# Altium schematic sheet PMUIO _ VCCIO.schdoc
size 297 x 209 mm; Symbol: Drawing-Symbol_A4; Company: 嘉立创EDA; Version: V1.0; Page Size: A4; @Project Name: RK3566; @Update Date: 2026-09-30; @Create Date: 2026-05-20; Device: Drawing-Symbol_A4; @Board Name: Board1; @Page Name: P1; @Create Time: 01:20:11; @Page Count: 2; @Page No: 2; @Schematic Name: Schematic1; @Update Time: 01:20:11; @Assembly Variant: Basic; Border: 1; Title Block Position: 3; Size: A4; Width: 1170; Height: 825; Region Start: 1; X Region Count: 6; Y Region Count: 4; Blade Width: 10; SheetNumber: 3; SheetTotal: 11
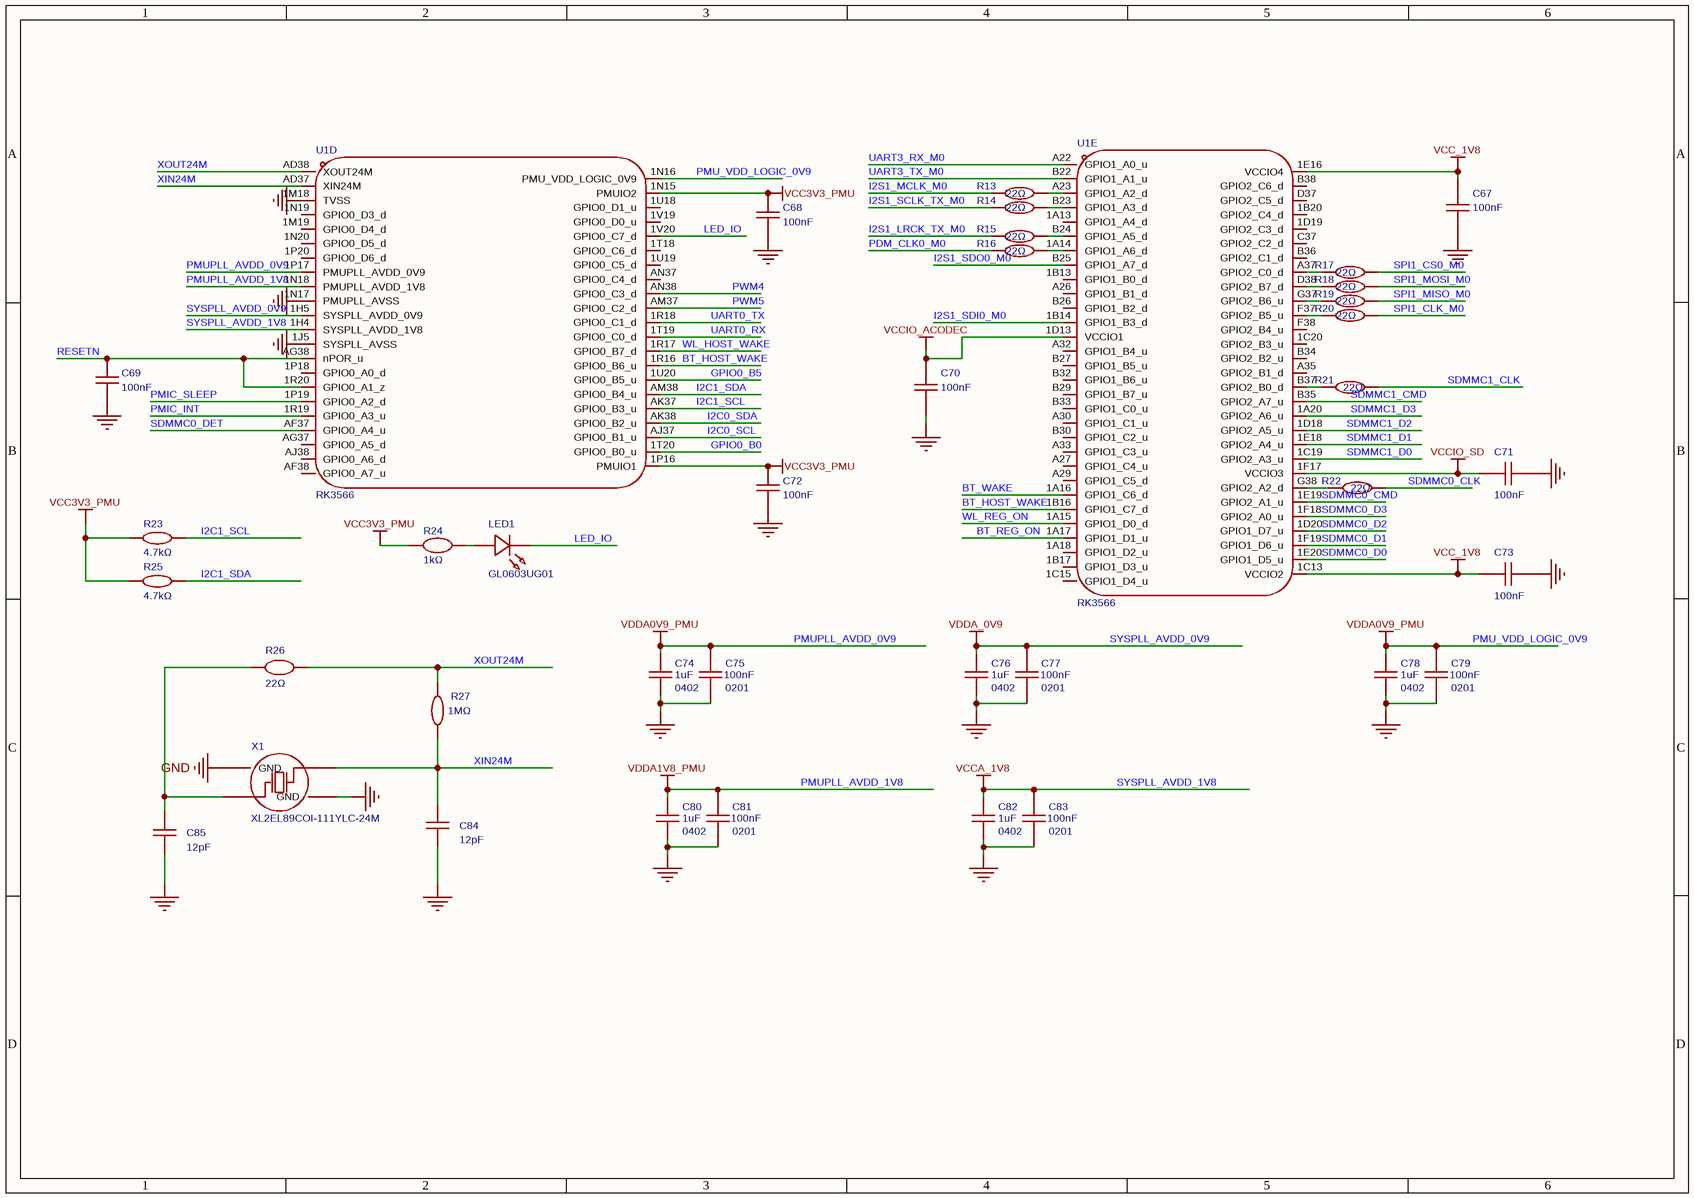
[diagram p0: PMUIO _ VCCIO.schdoc]

## Parts
C67  100nF  [C0201]
C68  100nF  [C0201]
C69  100nF  [C0201]
C70  100nF  [C0201]
C71  100nF  [C0201]
C72  100nF  [C0201]
C73  100nF  [C0201]
C74  1uF  Supplier Footprint: 0402  [C0402]
C75  100nF  Supplier Footprint: 0201  [C0201]
C76  1uF  Supplier Footprint: 0402  [C0402]
C77  100nF  Supplier Footprint: 0201  [C0201]
C78  1uF  Supplier Footprint: 0402  [C0402]
C79  100nF  Supplier Footprint: 0201  [C0201]
C80  1uF  Supplier Footprint: 0402  [C0402]
C81  100nF  Supplier Footprint: 0201  [C0201]
C82  1uF  Supplier Footprint: 0402  [C0402]
C83  100nF  Supplier Footprint: 0201  [C0201]
C84  12pF  [C0402]
C85  12pF  [C0402]
LED1  GL0603UG01  [LED0603-RD]
R13  22Ω  [R0402]
R14  22Ω  [R0402]
R15  22Ω  [R0402]
R16  22Ω  [R0402]
R17  22Ω  [R0402]
R18  22Ω  [R0402]
R19  22Ω  [R0402]
R20  22Ω  [R0402]
R21  22Ω  [R0402]
R22  22Ω  [R0402]
R23  4.7kΩ  [R0402]
R24  1kΩ  [R0603]
R25  4.7kΩ  [R0402]
R26  22Ω  [R0402]
R27  1MΩ  [R0402]
U1  RK3566  [BGA-565_L15.5-W14.4-P0.40_RK3566_1]  (parts D,E of 8)
X1  XL2EL89COI-111YLC-24M  [OSC-SMD_4P-L3.2-W2.5-BL]

## Nets
GND: C67.1 C68.1 C69.1 C70.1 C71.1 C72.1 C73.1 C74.1 C75.1 C76.1 C77.1 C78.1 C79.1 C80.1 C81.1 C82.1 C83.1 C84.1 C85.1 U1.1J5(SYSPLL_AVSS) U1.1M18(TVSS) U1.1N17(PMUPLL_AVSS) X1.2(GND) X1.4(GND)
PMU_VDD_LOGIC_0V9: C74.2 C75.2 C78.2 C79.2 U1.1N16(PMU_VDD_LOGIC_0V9) U1.1P17(PMUPLL_AVDD_0V9)  [also labelled PMUPLL_AVDD_0V9, VDDA0V9_PMU]
PMUPLL_AVDD_1V8: C80.2 C81.2 U1.1N18(PMUPLL_AVDD_1V8)  [also labelled VDDA1V8_PMU]
SYSPLL_AVDD_0V9: C76.2 C77.2 U1.1H5(SYSPLL_AVDD_0V9)  [also labelled VDDA_0V9]
SYSPLL_AVDD_1V8: C82.2 C83.2 U1.1H4(SYSPLL_AVDD_1V8)  [also labelled VCCA_1V8]
VCC3V3_PMU: C68.2 C72.2 R23.1 R24.1 R25.1 U1.1N15(PMUIO2) U1.1P16(PMUIO1)
VCC_1V8: C67.2 C73.2 U1.1C13(VCCIO2) U1.1E16(VCCIO4)
VCCIO_ACODEC: C70.2 U1.1D13(VCCIO1)
VCCIO_SD: C71.2 U1.1F17(VCCIO3)
BT_HOST_WAKE: U1.1B16(GPIO1_C7_d) U1.1R16(GPIO0_B6_u)
BT_REG_ON: U1.1A17(GPIO1_D1_u)
BT_WAKE: U1.1A16(GPIO1_C6_d)
GPIO0_B0: U1.1T20(GPIO0_B0_u)
GPIO0_B5: U1.1U20(GPIO0_B5_u)
I2C0_SCL: U1.AJ37(GPIO0_B1_u)
I2C0_SDA: U1.AK38(GPIO0_B2_u)
I2C1_SCL: R23.2 U1.AK37(GPIO0_B3_u)
I2C1_SDA: R25.2 U1.AM38(GPIO0_B4_u)
I2S1_LRCK_TX_M0: R15.1
I2S1_MCLK_M0: R13.1
I2S1_SCLK_TX_M0: R14.1
I2S1_SDI0_M0: U1.1B14(GPIO1_B3_d)
I2S1_SDO0_M0: U1.B25(GPIO1_A7_d)
LED_IO: LED1.1(K) U1.1V20(GPIO0_C7_d)
PDM_CLK0_M0: R16.1
PMIC_INT: U1.1R19(GPIO0_A3_u)
PMIC_SLEEP: U1.1P19(GPIO0_A2_d)
PWM4: U1.AN38(GPIO0_C3_d)
PWM5: U1.AM37(GPIO0_C2_d)
RESETN: C69.2 U1.1R20(GPIO0_A1_z) U1.AG38(nPOR_u)
SDMMC0_CLK: R22.2
SDMMC0_CMD: U1.1E19(GPIO2_A1_u)
SDMMC0_D0: U1.1E20(GPIO1_D5_u)
SDMMC0_D1: U1.1F19(GPIO1_D6_u)
SDMMC0_D2: U1.1D20(GPIO1_D7_u)
SDMMC0_D3: U1.1F18(GPIO2_A0_u)
SDMMC0_DET: U1.AF37(GPIO0_A4_u)
SDMMC1_CLK: R21.2
SDMMC1_CMD: U1.B35(GPIO2_A7_u)
SDMMC1_D0: U1.1C19(GPIO2_A3_u)
SDMMC1_D1: U1.1E18(GPIO2_A4_u)
SDMMC1_D2: U1.1D18(GPIO2_A5_u)
SDMMC1_D3: U1.1A20(GPIO2_A6_u)
SPI1_CLK_M0: R20.2
SPI1_CS0_M0: R17.2
SPI1_MISO_M0: R19.2
SPI1_MOSI_M0: R18.2
UART0_RX: U1.1T19(GPIO0_C0_d)
UART0_TX: U1.1R18(GPIO0_C1_d)
UART3_RX_M0: U1.A22(GPIO1_A0_u)
UART3_TX_M0: U1.B22(GPIO1_A1_u)
WL_HOST_WAKE: U1.1R17(GPIO0_B7_d)
WL_REG_ON: U1.1A15(GPIO1_D0_d)
XIN24M: C84.2 R27.1 U1.AD37(XIN24M) X1.3(OSC2)
XOUT24M: R26.2 R27.2 U1.AD38(XOUT24M)
NetC85_2: C85.2 R26.1 X1.1(OSC1)
NetLED1_2: LED1.2(A) R24.2
NetR13_2: R13.2 U1.A23(GPIO1_A2_d)
NetR14_2: R14.2 U1.B23(GPIO1_A3_d)
NetR15_2: R15.2 U1.B24(GPIO1_A5_d)
NetR16_2: R16.2 U1.1A14(GPIO1_A6_d)
NetR17_1: R17.1 U1.A37(GPIO2_C0_d)
NetR18_1: R18.1 U1.D38(GPIO2_B7_d)
NetR19_1: R19.1 U1.G37(GPIO2_B6_u)
NetR20_1: R20.1 U1.F37(GPIO2_B5_u)
NetR21_1: R21.1 U1.B37(GPIO2_B0_d)
NetR22_1: R22.1 U1.G38(GPIO2_A2_d)

Not connected (* = marked no-connect by the designer): U1 1A13(GPIO1_A4_d) 1A18(GPIO1_D2_u) 1B13(GPIO1_B0_d) 1B17(GPIO1_D3_u) 1B20(GPIO2_C4_d) 1C15(GPIO1_D4_u) 1C20(GPIO2_B3_u) 1D19(GPIO2_C3_d) 1M19(GPIO0_D4_d) 1N19(GPIO0_D3_d) 1N20(GPIO0_D5_d) 1P18(GPIO0_A0_d) 1P20(GPIO0_D6_d) 1T18(GPIO0_C6_d) 1U18(GPIO0_D1_u) 1U19(GPIO0_C5_d) 1V19(GPIO0_D0_u) A26(GPIO1_B1_d) A27(GPIO1_C4_u) A29(GPIO1_C5_d) A30(GPIO1_C1_u) A32(GPIO1_B4_u) A33(GPIO1_C3_u) A35(GPIO2_B1_d) AF38(GPIO0_A7_u) AG37(GPIO0_A5_d) AJ38(GPIO0_A6_d) AN37(GPIO0_C4_d) B26(GPIO1_B2_d) B27(GPIO1_B5_u) B29(GPIO1_B7_u) B30(GPIO1_C2_u) B32(GPIO1_B6_u) B33(GPIO1_C0_u) B34(GPIO2_B2_u) B36(GPIO2_C1_d) B38(GPIO2_C6_d) C37(GPIO2_C2_d) D37(GPIO2_C5_d) F38(GPIO2_B4_u)

## Notes on the sheet
- 创建日期
- 2026-09-30
- 原理图
- 板子
- Schematic1
- Board1
- 更新日期
- 图页
- P1
- 绘制
- 审阅
- RK3566
- 版本
- V1.0
- 尺寸
- A4
- 页    2    共    2
- 嘉立创EDA

## Library data of the parts
C67 C70 C71 C73 C75 C77 C79 C81 C83 = CL03A104KO3NNNC: 容值:100nF;精度:±10%;额定电压:16V;材质(温度系数):X5R;; Manufacturer: SAMSUNG(三星); Symbol: CL05B104KB54PNC; 3D Model: e8033a7cb35143ffb28e3b81b2577ea0; 3D Model Transform: 23.622,11.811,0,0,0,0,0,0,0; Tolerance: ±10%; Voltage Rated: 16V; Temperature Coefficient: X5R; AddInBom: yes; ModelName: C0201_L0.6-W0.3-H0.3; Device: CL03A104KO3NNNC; JLCPCB Part Class: Extended Part; LCSC Part Name: 100nF ±10% 16V; Supplier Part: C307380; Manufacturer Part: CL03A104KO3NNNC; Datasheet: https://atta.szlcsc.com/upload/public/pdf/source/20181009/C307380_E0679AAF9658ADA26DBF30CED0CA6925.pdf; Supplier: LCSC; Value: 100nF; ConvertToPcb: yes; FootprintName: C0201
  C67 C70 C71 C73: Supplier Footprint: 0201
C68 C69 C72 = GRM033R61E104KE14D: 容值:100nF;精度:±10%;额定电压:25V;温度系数:X5R;; Manufacturer: muRata(村田); 3D Model: e8033a7cb35143ffb28e3b81b2577ea0聨0819f05c4eef4c71ace90d822a990e87; 3D Model Transform: 23.622,11.811,0,0,0,0,0,0,0; Tolerance: ±10%; Voltage Rating: 25V; Temperature Coefficient: X5R; AddInBom: yes; ModelName: C0201_L0.6-W0.3-H0.3; Symbol: GRM033R61E104KE14D; Device: GRM033R61E104KE14D; LCSC Part Name: 100nF ±10% 25V; Supplier Part: C76939; Manufacturer Part: GRM033R61E104KE14D; Supplier Footprint: 0201; JLCPCB Part Class: Extended Part; Datasheet: https://item.szlcsc.com/datasheet/GRM033R61E104KE14D/78066.html; Supplier: LCSC; Value: 100nF; ConvertToPcb: yes; FootprintName: C0201
C74 C76 C78 C80 C82 = CL05A105KP5NNNC: 容值:1uF;精度:±10%;额定电压:10V;材质(温度系数):X5R;; Manufacturer: SAMSUNG(三星); 3D Model: 36a51122f27c49738f86b3bfa98863e0; 3D Model Transform: 39.37,19.685,0,0,0,0,0,0,0; Tolerance: ±10%; Voltage Rated: 10V; Temperature Coefficient: X5R; AddInBom: yes; ModelName: C0402_L1.0-W0.5-H0.5; Symbol: CL05A105KP5NNNC; Device: CL05A105KP5NNNC; LCSC Part Name: 1uF ±10% 10V; Supplier Part: C14445; Manufacturer Part: CL05A105KP5NNNC; JLCPCB Part Class: 扩展库; Datasheet: https://atta.szlcsc.com/upload/public/pdf/source/20160103/1457707670698.pdf; Supplier: LCSC; Value: 1uF; ConvertToPcb: yes; FootprintName: C0402
C84 C85 = CC0402JRNPO9BN120: 容值:12pF;精度:±5%;额定电压:50V;温度系数:NP0;; Manufacturer: YAGEO(国巨); AddInBom: yes; ModelId: 36a51122f27c49738f86b3bfa98863e0聨0819f05c4eef4c71ace90d822a990e87; ModelName: C0402_L1.0-W0.5-H0.5; ModelTransform: 39.37,19.685,0,0,0,0,0,0,0; Tolerance: ±5%; Voltage Rating: 50V; Temperature Coefficient: NP0; Symbol: CC0402JRNPO9BN120; Device: CC0402JRNPO9BN120; LCSC Part Name: 12pF ±5% 50V; SupplierPart: C106201; ManufacturerPart: CC0402JRNPO9BN120; Supplier Footprint: 0402; JLCPCB Part Class: Extended Part; Datasheet: https://item.szlcsc.com/datasheet/CC0402JRNPO9BN120/107416.html; Supplier: LCSC; ConvertToPcb: yes; FootprintName: C0402; Value: 12pF
LED1 = GL0603UG01: 灯头类型:-;发光颜色:翠绿色;正向压降(Vf):2.7V~3.2V;功率:-;测试电流:20mA;波长:510nm~531nm;二极管配置:独立二极管;透镜颜色:无色透明透镜;色温:-;发光强度:173mcd~350mcd;发光角度:120°;载带方式:正贴;工作温度:-40℃~+85℃;; Manufacturer: Guiguang light(桂光光电); AddInBom: yes; ModelId: 1f0d29a91be547639d425604e9b96ebb聨0819f05c4eef4c71ace90d822a990e87; ModelTransform: 63.7794,32.283,0,0,0,0,0,0,0; Illumination Color: 翠绿色; Test Current: 20mA; Diode Configuration: 独立二极管; Lens Color: 无色透明透镜; Viewing Angle: 120°; Symbol: GL0603UG01; Device: GL0603UG01; LCSC Part Name: 0603 翠绿 高亮; SupplierPart: C51933293; ManufacturerPart: GL0603UG01; Supplier Footprint: 0603; JLCPCB Part Class: Extended Part; Datasheet: https://item.szlcsc.com/datasheet/GL0603UG01/54645989.html; Supplier: LCSC; ConvertToPcb: yes; FootprintName: LED0603-RD; ModelName: LED0603-RD; Lamp Holder Type: -; Voltage - Forward(Vf): 2.7V~3.2V; Power(Watts): -; Wavelength - Dominant: 510nm~531nm; Peak Wavelength: -; Color Temperature: -; Luminous Intensity: 173mcd~350mcd; Mounting Style: 正贴; Operating Temperature: -40℃~+85℃
R13-R16 = 0402WGF220JTCE: 电阻类型:厚膜电阻;阻值:22Ω;精度:±1%;功率:62.5mW;最大工作电压:50V;温度系数:±100ppm/℃;; Manufacturer: UNI-ROYAL(厚声); AddInBom: yes; ModelId: 98c88bc2b9094f218f3a3e30a7012738聨0819f05c4eef4c71ace90d822a990e87; ModelName: R0402_L1.0-W0.5-H0.4; ModelTransform: 39.37,19.685,0,0,0,0,0,0,0; Tolerance: ±1%; Power(Watts): 62.5mW; Overload Voltage (Max): 50V; Symbol: 0402WGF220JTCE; Device: 0402WGF220JTCE; LCSC Part Name: 22Ω ±1% 62.5mW 厚膜电阻; SupplierPart: C25092; ManufacturerPart: 0402WGF220JTCE; Supplier Footprint: 0402; JLCPCB Part Class: Basic Part; Datasheet: https://atta.szlcsc.com/upload/public/pdf/source/20200306/C422600_1E6D84923E4A46A82E41ADD87F860B5C.pdf; Supplier: LCSC; ConvertToPcb: yes; FootprintName: R0402; Type: 厚膜电阻; Value: 22Ω; Temperature Coefficient: ±100ppm/℃; Operating Temperature Range: -55℃~+155℃
R17-R22 = RC0402FR-0722RL: 电阻类型:厚膜电阻;阻值:22Ω;精度:±1%;功率:62.5mW;工作电压:50V;温度系数:±100ppm/℃;; Manufacturer: YAGEO(国巨); 3D Model: 98c88bc2b9094f218f3a3e30a7012738聨0819f05c4eef4c71ace90d822a990e87; 3D Model Transform: 39.37,19.685,0,0,0,0,0,0,0; Tolerance: ±1%; Power(Watts): 62.5mW; Voltage-Supply(Max): 50V; AddInBom: yes; ModelName: R0402_L1.0-W0.5-H0.4; Symbol: RC0402FR-0722RL; Device: RC0402FR-0722RL; LCSC Part Name: 厚膜电阻 22Ω ±1% 62.5mW; Supplier Part: C114765; Manufacturer Part: RC0402FR-0722RL; Supplier Footprint: 0402; JLCPCB Part Class: Extended Part; Datasheet: https://item.szlcsc.com/datasheet/RC0402FR-0722RL/116009.html; Supplier: LCSC; Type: 厚膜电阻; Value: 22Ω; Temperature Coefficient: ±100ppm/℃; Operating Temperature: -55℃~+155℃; ConvertToPcb: yes; FootprintName: R0402
R23 R25 = RC0402FR-074K7L: 电阻类型:厚膜电阻;阻值:4.7kΩ;精度:±1%;功率:62.5mW;工作电压:50V;温度系数:±100ppm/℃;; Manufacturer: YAGEO(国巨); AddInBom: yes; ModelId: 98c88bc2b9094f218f3a3e30a7012738聨0819f05c4eef4c71ace90d822a990e87; ModelName: R0402_L1.0-W0.5-H0.4; ModelTransform: 39.37,19.685,0,0,0,0,0,0,0; Tolerance: ±1%; Power(Watts): 62.5mW; Voltage-Supply(Max): 50V; Symbol: RC0402FR-074K7L; Device: RC0402FR-074K7L; LCSC Part Name: 厚膜电阻 4.7kΩ ±1% 62.5mW; SupplierPart: C105871; ManufacturerPart: RC0402FR-074K7L; Supplier Footprint: 0402; JLCPCB Part Class: Extended Part; Datasheet: https://item.szlcsc.com/datasheet/RC0402FR-074K7L/107086.html; Supplier: LCSC; ConvertToPcb: yes; FootprintName: R0402; Type: 厚膜电阻; Value: 4.7kΩ; Temperature Coefficient: ±100ppm/℃; Operating Temperature: -55℃~+155℃
R24 = FRC0603F1001TS: 电阻类型:厚膜电阻;阻值:1kΩ;精度:±1%;功率:100mW;工作电压:75V;温度系数:±100ppm/℃;; Manufacturer: FOJAN(富捷); AddInBom: yes; ModelId: fc143cca1e79419f9cd78b61e9279f08聨0819f05c4eef4c71ace90d822a990e87; ModelTransform: 31.8897,63.7794,0,90,0,0,0,0,0; Tolerance: ±1%; Power(Watts): 100mW; Voltage-Supply(Max): 75V; Symbol: FRC0603F1001TS; Device: FRC0603F1001TS; LCSC Part Name: 1kΩ ±1% 100mW 厚膜电阻; SupplierPart: C2907002; ManufacturerPart: FRC0603F1001TS; Supplier Footprint: 0603; JLCPCB Part Class: Extended Part; Datasheet: https://item.szlcsc.com/datasheet/FRC0603F1001TS/3180515.html; Supplier: LCSC; ConvertToPcb: yes; FootprintName: R0603; ModelName: R0603; Type: 厚膜电阻; Value: 1kΩ; Temperature Coefficient: ±100ppm/℃; Operating Temperature: -55℃~+155℃
R26 = 0402WGF220JTCE: 电阻类型:厚膜电阻;阻值:22Ω;精度:±1%;功率:62.5mW;温度系数:±100ppm/℃;; Manufacturer: UNI-ROYAL(厚声); Symbol: ERJPA2F22R0X; 3D Model: 671aefced39d4c318694bba8bd8efd39; 3D Model Transform: 39.37,19.685,0,0,0,0,0,0.0005,0; Tolerance: ±1%; Power(Watts): 62.5mW; Overload Voltage (Max): 50V; AddInBom: yes; ModelName: R0402_L1.0-W0.5-H0.5; Device: 0402WGF220JTCE; LCSC Part Name: 厚膜电阻 22Ω ±1% 62.5mW; Supplier Part: C25092; Manufacturer Part: 0402WGF220JTCE; Supplier Footprint: 0402; JLCPCB Part Class: Basic Part; Datasheet: https://atta.szlcsc.com/upload/public/pdf/source/20200306/C422600_1E6D84923E4A46A82E41ADD87F860B5C.pdf; Supplier: LCSC; Type: 厚膜电阻; Value: 22Ω; Temperature Coefficient: ±100ppm/℃; Operating Temperature Range: -55℃~+155℃; ConvertToPcb: yes; FootprintName: R0402
R27 = RMC04021M5%N: 阻值:1MΩ;精度:±5%;功率:62.5mW;; Manufacturer: Tyohm(幸亚电阻); 3D Model: 671aefced39d4c318694bba8bd8efd39; 3D Model Transform: 39.37,19.685,0,0,0,0,0,0.0005,0; Tolerance: ±5%; Power(Watts): 62.5mW; AddInBom: yes; ModelName: R0402_L1.0-W0.5-H0.5; Symbol: RMC04021M5%N; Device: RMC04021M5%N; LCSC Part Name: 1MΩ ±5% 62.5mW; Supplier Part: C325525; Manufacturer Part: RMC04021M5%N; Supplier Footprint: 0402; JLCPCB Part Class: 扩展库; Datasheet: https://atta.szlcsc.com/upload/public/pdf/source/20190115/C325525_90ADED69DA9348756F9671214E48FF04.pdf; Supplier: LCSC; Value: 1MΩ; ConvertToPcb: yes; FootprintName: R0402
U1 = RK3566: 是一款高性能、低功耗的四核应用处理器，专为个人移动互联网设备和AIoT设备设计。提供了许多嵌入式强大硬件引擎，以优化高端应用的性能。支持几乎全格式的H.264 4K@60fps解码器、H.265 4K@60fps解码器，还支持H.264/H.265 1080p@60fps编码器、高质量JPEG编码器/解码器。嵌入式3D GPU使其完全兼容OpenGL ES 1.1/2.0/3.2、OpenCL 2.0和Vulkan 1.1; Manufacturer: Rockchip(瑞芯微); Relevance: []; AddInBom: yes; ModelId: 096be4498db445d8b521581a084e15ec聨0819f05c4eef4c71ace90d822a990e87; ModelTransform: 610.235,566.928,0,0,0,0,0,0,0; Symbol: RK3566; Device: RK3566; LCSC Part Name: 表面贴装型开关全行程、动作力等性能; SupplierPart: C2943786; ManufacturerPart: RK3566; Supplier Footprint: BGA-565(15.5x14.4); JLCPCB Part Class: Extended Part; Datasheet: https://item.szlcsc.com/datasheet/RK3566/3329057.html; Supplier: LCSC; ConvertToPcb: yes; FootprintName: BGA-565_L15.5-W14.4-P0.40_RK3566_1; ModelName: BGA-565_L15.5-W14.4-P0.40_RK3566_1
X1 = XL2EL89COI-111YLC-24M: 频率： 24MHZ 负载： 12PF 频率公差： ±10PPM 工作温度： -40~85℃; Manufacturer: YXC(扬兴晶振); Symbol: X1E000210127000G; Crystal Type: 贴片无源晶振; Load Capacitance: 9pF; Equivalent Series Resistance (ESR): 40Ω; 3D Model: ae22b8d143894765bc8100c37cb6356f; 3D Model Transform: 125.984,98.425,0,0,0,0,0,0,0; AddInBom: yes; ModelName: OSC-SMD_4P-L3.2-W2.5-H1.0; Device: XL2EL89COI-111YLC-24M; Datasheet: https://atta.szlcsc.com/upload/public/pdf/source/20161130/1480474612820.pdf; Operating Temperature: -40℃~+85℃; Value: 24MHz; Frequency Tolerance: ±10ppm; Frequency Stability: -; LCSC Part Name: 24MHZ 12PF ±10PPM YSX321SL; JLCPCB Part Class: Extended Part; Supplier Part: C5444545; Manufacturer Part: XL2EL89COI-111YLC-24M; Supplier Footprint: SMD3225-4P; Supplier: LCSC; ConvertToPcb: yes; FootprintName: OSC-SMD_4P-L3.2-W2.5-BL